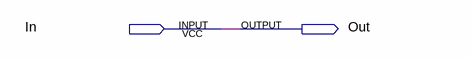
[diagram p0: schematic sheet]
// Quartus schematic 1Buffer.bdf as structural Verilog: 0 symbols, 2 pins
module \1Buffer  (
  input  In,
  output Out
);


  assign Out = In;
endmodule
